# Altium schematic sheet COREBOARD.SchDoc
size A4; SheetNumber: 6; SheetTotal: 6
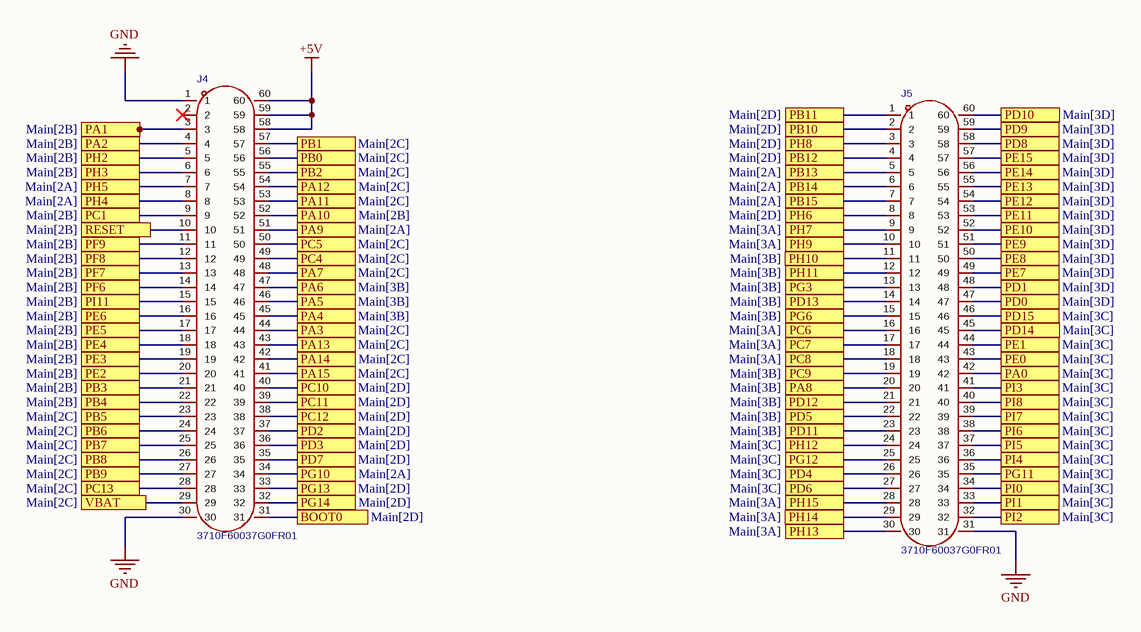
[diagram p0: COREBOARD.SchDoc]

## Parts
J4  3710F60037G0FR01  [CONN-TH_60P-P0.80_3710F60037G0FR01]
J5  3710F60037G0FR01  [CONN-TH_60P-P0.80_3710F60037G0FR01]

## Ports
BOOT0 (see Main[2D]), PA0 (see Main[3C]), PA1 (see Main[2B]), PA2 (see Main[2B]), PA3 (see Main[2C]), PA4 (see Main[3B]), PA5 (see Main[3B]), PA6 (see Main[3B]), PA7 (see Main[2C]), PA8 (see Main[3B]), PA9 (see Main[2A]), PA10 (see Main[2B]), PA11 (see Main[2C]), PA12 (see Main[2C]), PA13 (see Main[2C]), PA14 (see Main[2C]), PA15 (see Main[2C]), PB0 (see Main[2C]), PB1 (see Main[2C]), PB2 (see Main[2C]), PB3 (see Main[2B]), PB4 (see Main[2B]), PB5 (see Main[2C]), PB6 (see Main[2C]), PB7 (see Main[2C]), PB8 (see Main[2C]), PB9 (see Main[2C]), PB10 (see Main[2D]), PB11 (see Main[2D]), PB12 (see Main[2D]), PB13 (see Main[2A]), PB14 (see Main[2A]), PB15 (see Main[2A]), PC1 (see Main[2B]), PC4 (see Main[2C]), PC5 (see Main[2C]), PC6 (see Main[3A]), PC7 (see Main[3A]), PC8 (see Main[3A]), PC9 (see Main[3B]), PC10 (see Main[2D]), PC11 (see Main[2D]), PC12 (see Main[2D]), PC13 (see Main[2C]), PD0 (see Main[3D]), PD1 (see Main[3D]), PD2 (see Main[2D]), PD3 (see Main[2D]), PD4 (see Main[3C]), PD5 (see Main[3B]), PD6 (see Main[3C]), PD7 (see Main[2D]), PD8 (see Main[3D]), PD9 (see Main[3D]), PD10 (see Main[3D]), PD11 (see Main[3B]), PD12 (see Main[3B]), PD13 (see Main[3B]), PD14 (see Main[3C]), PD15 (see Main[3C]), PE0 (see Main[3C]), PE1 (see Main[3C]), PE2 (see Main[2B]), PE3 (see Main[2B]), PE4 (see Main[2B]), PE5 (see Main[2B]), PE6 (see Main[2B]), PE7 (see Main[3D]), PE8 (see Main[3D]), PE9 (see Main[3D]), PE10 (see Main[3D]), PE11 (see Main[3D]), PE12 (see Main[3D]), PE13 (see Main[3D]), PE14 (see Main[3D]), PE15 (see Main[3D]), PF6 (see Main[2B]), PF7 (see Main[2B]), PF8 (see Main[2B]), PF9 (see Main[2B]), PG3 (see Main[3B]), PG6 (see Main[3B]), PG10 (see Main[2A]), PG11 (see Main[3C]), PG12 (see Main[3C]), PG13 (see Main[2D]), PG14 (see Main[2D]), PH2 (see Main[2B]), PH3 (see Main[2B]), PH4 (see Main[2A]), PH5 (see Main[2A]), PH6 (see Main[2D]), PH7 (see Main[3A]), PH8 (see Main[2D]), PH9 (see Main[3A]), PH10 (see Main[3B]), PH11 (see Main[3B]), PH12 (see Main[3C]), PH13 (see Main[3A]), PH14 (see Main[3A]), PH15 (see Main[3A]), PI0 (see Main[3C]), PI1 (see Main[3C]), PI2 (see Main[3C]), PI3 (see Main[3C]), PI4 (see Main[3C]), PI5 (see Main[3C]), PI6 (see Main[3C]), PI7 (see Main[3C]), PI8 (see Main[3C]), PI11 (see Main[2B]), RESET (see Main[2B]), VBAT (see Main[2C])

## Nets
+5V: J4.58 J4.59 J4.60
GND: J4.1 J4.30 J5.31
BOOT0: J4.31 ; port BOOT0
PA0: J5.42 ; port PA0
PA1: J4.3 ; port PA1
PA2: J4.4 ; port PA2
PA3: J4.44 ; port PA3
PA4: J4.45 ; port PA4
PA5: J4.46 ; port PA5
PA6: J4.47 ; port PA6
PA7: J4.48 ; port PA7
PA8: J5.20 ; port PA8
PA9: J4.51 ; port PA9
PA10: J4.52 ; port PA10
PA11: J4.53 ; port PA11
PA12: J4.54 ; port PA12
PA13: J4.43 ; port PA13
PA14: J4.42 ; port PA14
PA15: J4.41 ; port PA15
PB0: J4.56 ; port PB0
PB1: J4.57 ; port PB1
PB2: J4.55 ; port PB2
PB3: J4.21 ; port PB3
PB4: J4.22 ; port PB4
PB5: J4.23 ; port PB5
PB6: J4.24 ; port PB6
PB7: J4.25 ; port PB7
PB8: J4.26 ; port PB8
PB9: J4.27 ; port PB9
PB10: J5.2 ; port PB10
PB11: J5.1 ; port PB11
PB12: J5.4 ; port PB12
PB13: J5.5 ; port PB13
PB14: J5.6 ; port PB14
PB15: J5.7 ; port PB15
PC1: J4.9 ; port PC1
PC4: J4.49 ; port PC4
PC5: J4.50 ; port PC5
PC6: J5.16 ; port PC6
PC7: J5.17 ; port PC7
PC8: J5.18 ; port PC8
PC9: J5.19 ; port PC9
PC10: J4.40 ; port PC10
PC11: J4.39 ; port PC11
PC12: J4.38 ; port PC12
PC13: J4.28 ; port PC13
PD0: J5.47 ; port PD0
PD1: J5.48 ; port PD1
PD2: J4.37 ; port PD2
PD3: J4.36 ; port PD3
PD4: J5.26 ; port PD4
PD5: J5.22 ; port PD5
PD6: J5.27 ; port PD6
PD7: J4.35 ; port PD7
PD8: J5.58 ; port PD8
PD9: J5.59 ; port PD9
PD10: J5.60 ; port PD10
PD11: J5.23 ; port PD11
PD12: J5.21 ; port PD12
PD13: J5.14 ; port PD13
PD14: J5.45 ; port PD14
PD15: J5.46 ; port PD15
PE0: J5.43 ; port PE0
PE1: J5.44 ; port PE1
PE2: J4.20 ; port PE2
PE3: J4.19 ; port PE3
PE4: J4.18 ; port PE4
PE5: J4.17 ; port PE5
PE6: J4.16 ; port PE6
PE7: J5.49 ; port PE7
PE8: J5.50 ; port PE8
PE9: J5.51 ; port PE9
PE10: J5.52 ; port PE10
PE11: J5.53 ; port PE11
PE12: J5.54 ; port PE12
PE13: J5.55 ; port PE13
PE14: J5.56 ; port PE14
PE15: J5.57 ; port PE15
PF6: J4.14 ; port PF6
PF7: J4.13 ; port PF7
PF8: J4.12 ; port PF8
PF9: J4.11 ; port PF9
PG3: J5.13 ; port PG3
PG6: J5.15 ; port PG6
PG10: J4.34 ; port PG10
PG11: J5.35 ; port PG11
PG12: J5.25 ; port PG12
PG13: J4.33 ; port PG13
PG14: J4.32 ; port PG14
PH2: J4.5 ; port PH2
PH3: J4.6 ; port PH3
PH4: J4.8 ; port PH4
PH5: J4.7 ; port PH5
PH6: J5.8 ; port PH6
PH7: J5.9 ; port PH7
PH8: J5.3 ; port PH8
PH9: J5.10 ; port PH9
PH10: J5.11 ; port PH10
PH11: J5.12 ; port PH11
PH12: J5.24 ; port PH12
PH13: J5.30 ; port PH13
PH14: J5.29 ; port PH14
PH15: J5.28 ; port PH15
PI0: J5.34 ; port PI0
PI1: J5.33 ; port PI1
PI2: J5.32 ; port PI2
PI3: J5.41 ; port PI3
PI4: J5.36 ; port PI4
PI5: J5.37 ; port PI5
PI6: J5.38 ; port PI6
PI7: J5.39 ; port PI7
PI8: J5.40 ; port PI8
PI11: J4.15 ; port PI11
RESET: J4.10 ; port RESET
VBAT: J4.29 ; port VBAT

Not connected (* = marked no-connect by the designer): J4 2*

## Library data of the parts
J4 J5 = 3710F60037G0FR01: AddInBom: yes; ModelId: ea88157e74564cd790d3fb822bd5b75b聨0819f05c4eef4c71ace90d822a990e87; ModelTransform: 1170.864,236.22,0,0,0,0,-0.003,0.006,-27.559; Symbol: 3710F60037G0FR01; Device: 3710F60037G0FR01; LCSC Part Name: 3710F60037G0FR01; SupplierPart: C9900157213; ManufacturerPart: 3710F60037G0FR01; Supplier Footprint: SMD,P=0.8mm; JLCPCB Part Class: Extended Part; Supplier: LCSC; ConvertToPcb: yes; FootprintName: CONN-TH_60P-P0.80_3710F60037G0FR01; ModelName: CONN-TH_60P-P0.80_3710F60037G0FR01